# Altium project Main-Board-v1.0.PrjPcb (part 5 of 5)

## Sheet ESP32-Sheet.SchDoc
size 420 x 297 mm; SheetNumber: 4; SheetTotal: 7
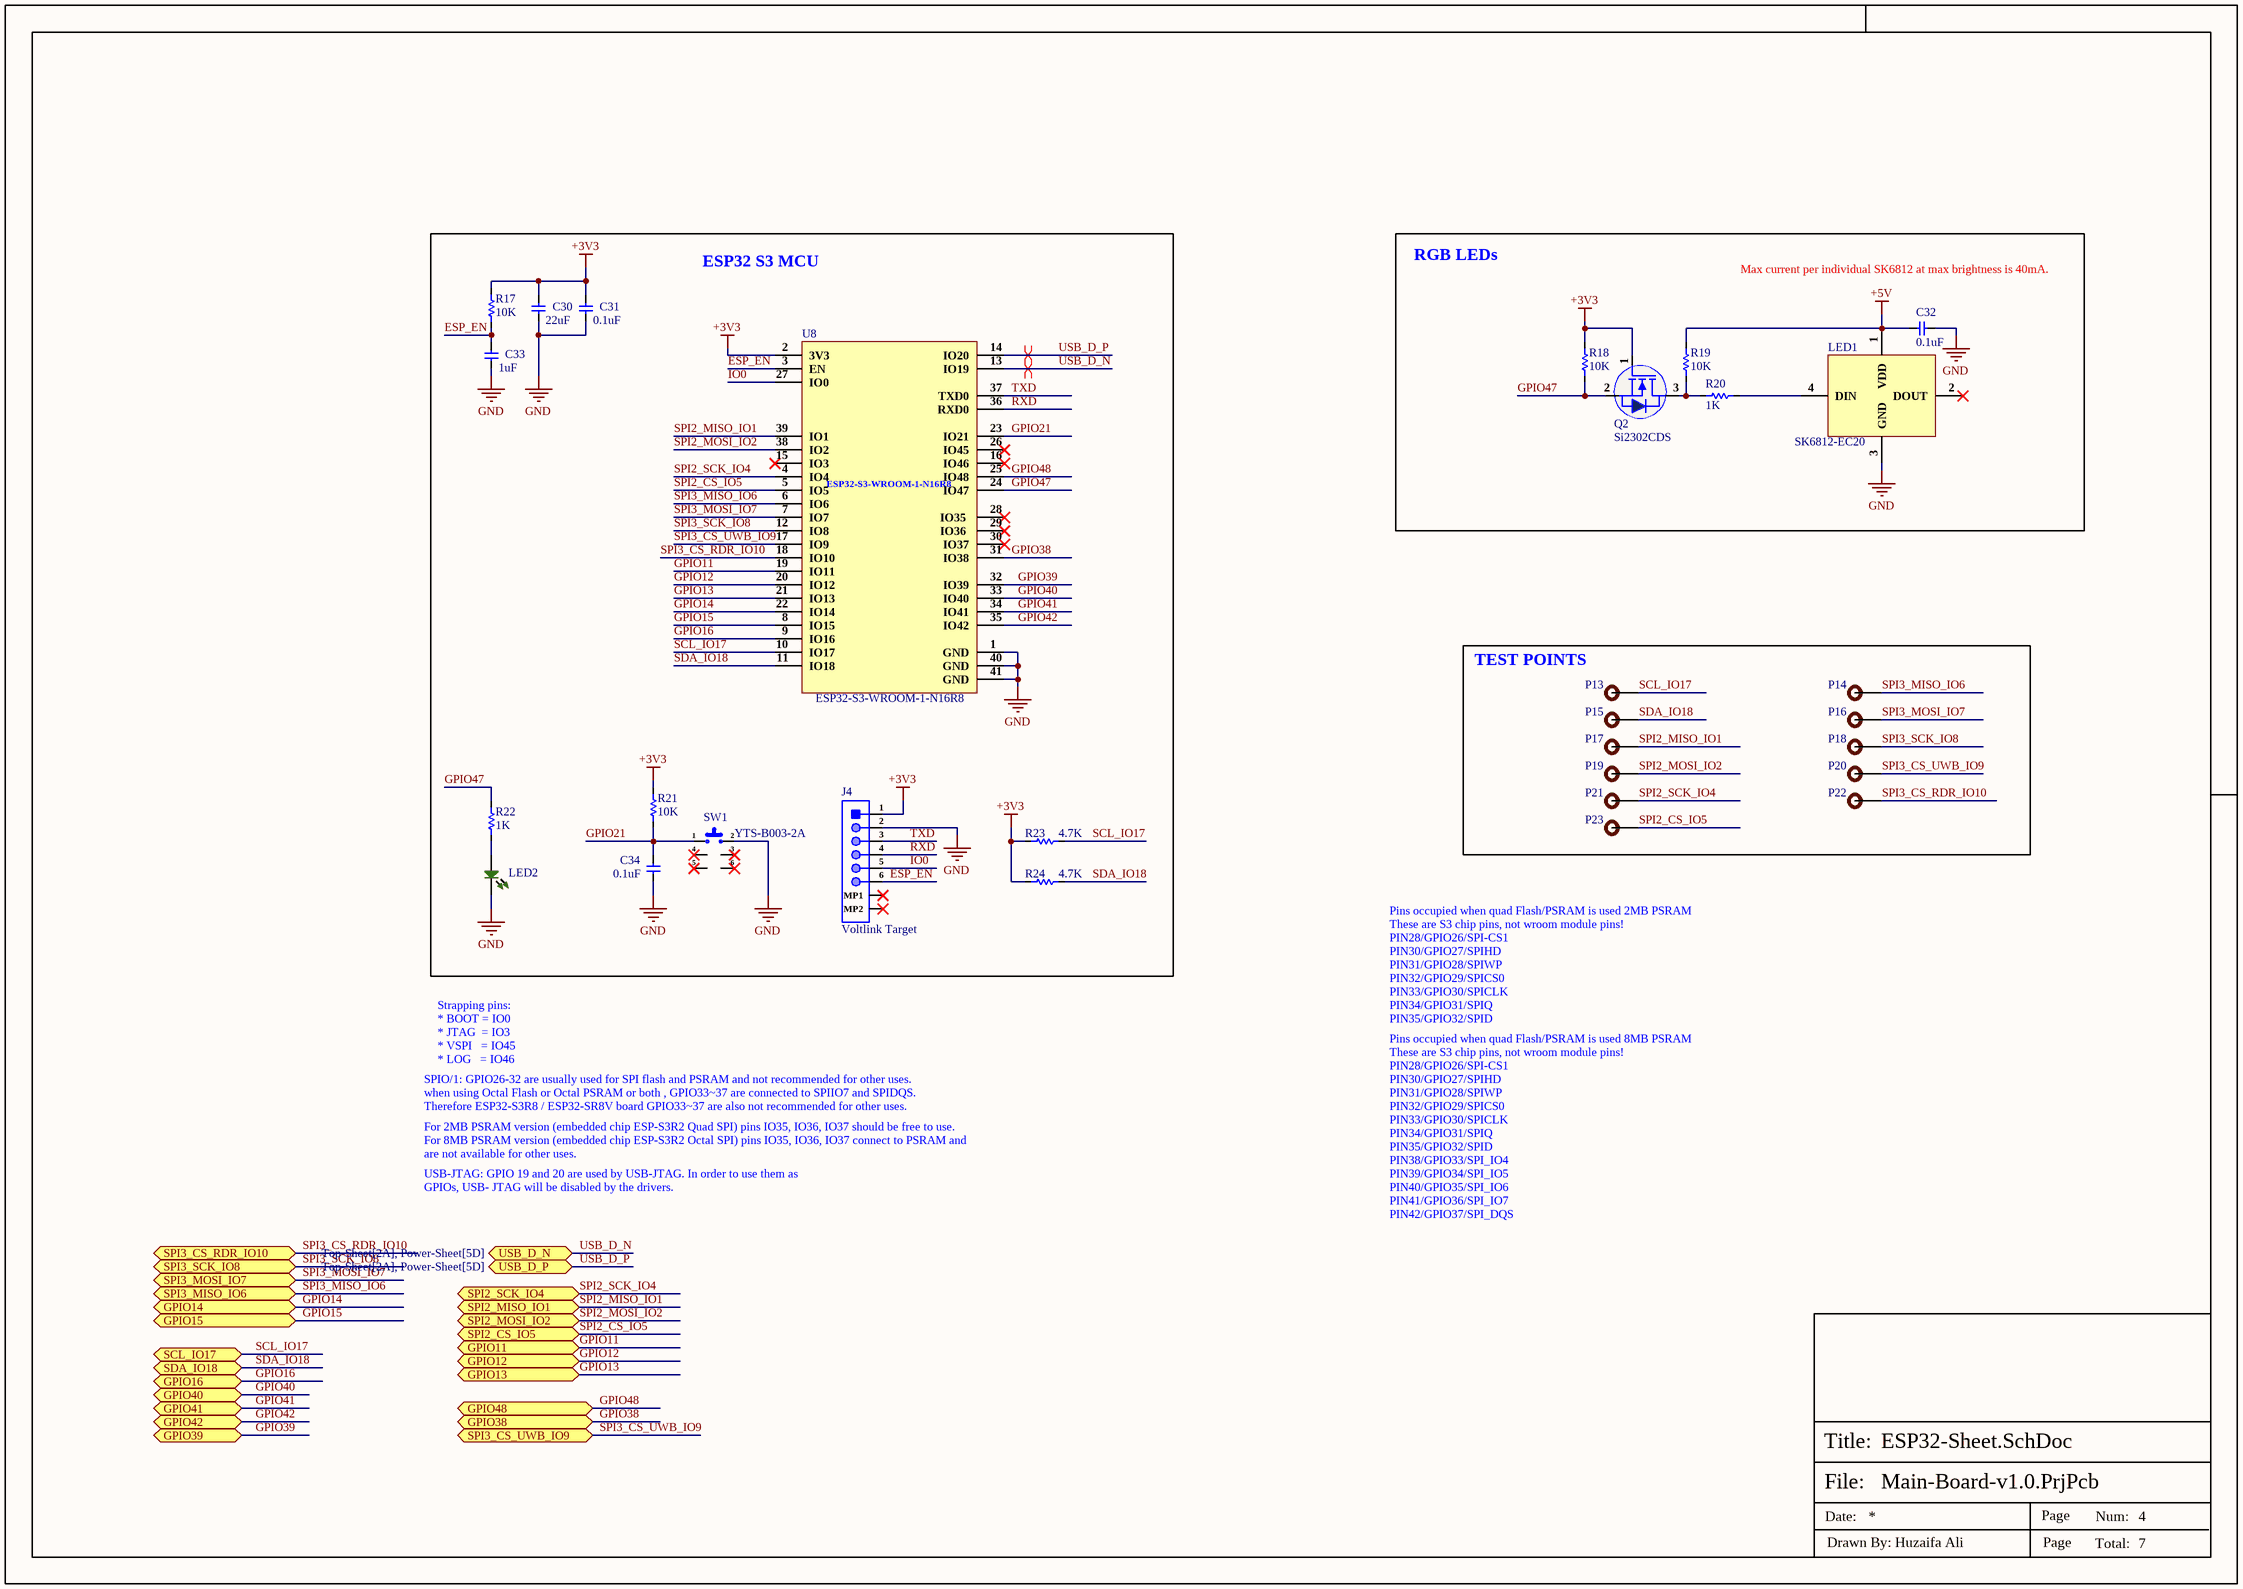
[diagram p5: ESP32-Sheet.SchDoc]

### Parts
C30  22uF  [Cap-0603]
C31  0.1uF  [Cap-0402]
C32  0.1uF  [Cap-0402]
C33  1uF  [Cap-0402]
C34  0.1uF  [Cap-0402]
J4  Voltlink Target  [Voltlink Target]
LED1  SK6812-EC20  [SK6812-EC20]
LED2  XZVG68W-2  [LED-0402]  (value not drawn)
P13  TEST POINT  [Test-point]  (value not drawn)
P14  TEST POINT  [Test-point]  (value not drawn)
P15  TEST POINT  [Test-point]  (value not drawn)
P16  TEST POINT  [Test-point]  (value not drawn)
P17  TEST POINT  [Test-point]  (value not drawn)
P18  TEST POINT  [Test-point]  (value not drawn)
P19  TEST POINT  [Test-point]  (value not drawn)
P20  TEST POINT  [Test-point]  (value not drawn)
P21  TEST POINT  [Test-point]  (value not drawn)
P22  TEST POINT  [Test-point]  (value not drawn)
P23  TEST POINT  [Test-point]  (value not drawn)
Q2  Si2302CDS  [Sot-23]
R17  10K  [Res-0402]
R18  10K  [Res-0402]
R19  10K  [Res-0402]
R20  1K  [Res-0603]
R21  10K  [Res-0603]
R22  1K  [Res-0603]
R23  4.7K  [Res-0603]
R24  4.7K  [Res-0603]
SW1  YTS-B003-2A  [YTS-B003-2A]
U8  ESP32-S3-WROOM-1-N16R8  [41-SMD Module]

### Blocks framed on the sheet
ESP32 S3 MCU: C30 C31 C33 C34 J4 LED2 R17 R21-R24 SW1 U8
RGB LEDs: C32 LED1 Q2 R18-R20
TEST POINTS: P13-P23

### Ports
GPIO11 (bidir, see Top-Sheet[2B]), GPIO12 (bidir, see Top-Sheet[2B]), GPIO13 (bidir, see Top-Sheet[2B]), GPIO14 (bidir, see Top-Sheet[3B]), GPIO15 (bidir, see Top-Sheet[3B]), GPIO16 (bidir, see Top-Sheet[3A]), GPIO38 (bidir, see Top-Sheet[3C]), GPIO39 (bidir, see Top-Sheet[3B]), GPIO40 (bidir, see Top-Sheet[3A]), GPIO41 (bidir, see Top-Sheet[3B]), GPIO42 (bidir, see Top-Sheet[3B]), GPIO48 (bidir, see Top-Sheet[3C]), SCL_IO17 (bidir, see Top-Sheet[3A]), SDA_IO18 (bidir, see Top-Sheet[3A]), SPI2_CS_IO5 (bidir, see Top-Sheet[2B]), SPI2_MISO_IO1 (bidir, see Top-Sheet[2B]), SPI2_MOSI_IO2 (bidir, see Top-Sheet[2B]), SPI2_SCK_IO4 (bidir, see Top-Sheet[2B]), SPI3_CS_RDR_IO10 (bidir, see Top-Sheet[3B]), SPI3_CS_UWB_IO9 (bidir, see Top-Sheet[3C]), SPI3_MISO_IO6 (bidir, see Top-Sheet[3B]), SPI3_MOSI_IO7 (bidir, see Top-Sheet[3B]), SPI3_SCK_IO8 (bidir, see Top-Sheet[3B]), USB_D_N (bidir, see Top-Sheet[2A], Power-Sheet[5D]), USB_D_P (bidir, see Top-Sheet[2A], Power-Sheet[5D])

### Nets
+3V3: C30.2 C31.2 J4.1 Q2.1(G) R17.2 R18.1 R21.2 R23.2 R24.2 U8.2(3V3)
+5V: C32.1 LED1.1(VDD) R19.1
GND: C30.1 C31.1 C32.2 C33.1 C34.1 J4.2 LED1.3(GND) LED2.2 SW1.2(NO) U8.1(GND) U8.40(GND) U8.41(GND)
ESP_EN: C33.2 J4.6 R17.1 U8.3(EN)
GPIO11: U8.19(IO11) ; port GPIO11  [project net W5500_RST]
GPIO12: U8.20(IO12) ; port GPIO12
GPIO13: U8.21(IO13) ; port GPIO13
GPIO14: U8.22(IO14) ; port GPIO14  [project net B5]
GPIO15: U8.8(IO15) ; port GPIO15  [project net B6]
GPIO16: U8.9(IO16) ; port GPIO16
GPIO21: C34.2 R21.1 SW1.1(COMMON) U8.23(IO21)
GPIO38: U8.31(IO38) ; port GPIO38
GPIO39: U8.32(IO39) ; port GPIO39
GPIO40: U8.33(IO40) ; port GPIO40
GPIO41: U8.34(IO41) ; port GPIO41
GPIO42: U8.35(IO42) ; port GPIO42
GPIO47: Q2.2(S) R18.2 R22.1 U8.24(IO47)
GPIO48: U8.25(IO48) ; port GPIO48
IO0: J4.5 U8.27(IO0)
RXD: J4.4 U8.36(RXD0)
SCL_IO17: P13.1 R23.1 U8.10(IO17) ; port SCL_IO17  [project net SCL]
SDA_IO18: P15.1 R24.1 U8.11(IO18) ; port SDA_IO18  [project net SDA]
SPI2_CS_IO5: P23.1 U8.5(IO5) ; port SPI2_CS_IO5
SPI2_MISO_IO1: P17.1 U8.39(IO1) ; port SPI2_MISO_IO1
SPI2_MOSI_IO2: P19.1 U8.38(IO2) ; port SPI2_MOSI_IO2
SPI2_SCK_IO4: P21.1 U8.4(IO4) ; port SPI2_SCK_IO4
SPI3_CS_RDR_IO10: P22.1 U8.18(IO10) ; port SPI3_CS_RDR_IO10  [project net B1]
SPI3_CS_UWB_IO9: P20.1 U8.17(IO9) ; port SPI3_CS_UWB_IO9
SPI3_MISO_IO6: P14.1 U8.6(IO6) ; port SPI3_MISO_IO6  [project net B4]
SPI3_MOSI_IO7: P16.1 U8.7(IO7) ; port SPI3_MOSI_IO7  [project net B3]
SPI3_SCK_IO8: P18.1 U8.12(IO8) ; port SPI3_SCK_IO8  [project net B2]
TXD: J4.3 U8.37(TXD0)
USB_D_N: U8.13(IO19) ; port USB_D_N
USB_D_P: U8.14(IO20) ; port USB_D_P
NetLED1_4: LED1.4(DIN) R20.2
NetLED2_1: LED2.1 R22.2
NetQ2_3: Q2.3(D) R19.2 R20.1

Not connected (* = marked no-connect by the designer): J4 MP1* MP2*; LED1 2(DOUT)*; SW1 3* 4* 5* 6*; U8 15(IO3)* 16(IO46)* 26(IO45)* 28(IO35_)* 29(IO36_)* 30(IO37)*

### Layout directives
differential pair; net class USB; differential pair class USB_Lines; rule Impedance Constraint [Min = 87.00    Max = 92.00    ]; rule Matched Net Lengths [Tolerance = 0.508mm]: USB_D_N, USB_D_P

### Notes on the sheet
- Max current per individual SK6812 at max brightness is 40mA.
- Strapping pins:
  * BOOT = IO0
  * JTAG  = IO3
  * VSPI   = IO45
  * LOG   = IO46
- Pins occupied when quad Flash/PSRAM is used 2MB PSRAM
  These are S3 chip pins, not wroom module pins!
  PIN28/GPIO26/SPI-CS1
  PIN30/GPIO27/SPIHD
  PIN31/GPIO28/SPIWP
  PIN32/GPIO29/SPICS0
  PIN33/GPIO30/SPICLK
  PIN34/GPIO31/SPIQ
  PIN35/GPIO32/SPID
- SPIO/1: GPIO26-32 are usually used for SPI flash and PSRAM and not recommended for other uses.
  when using Octal Flash or Octal PSRAM or both , GPIO33~37 are connected to SPIIO7 and SPIDQS.
  Therefore ESP32-S3R8 / ESP32-SR8V board GPIO33~37 are also not recommended for other uses.
- USB-JTAG: GPIO 19 and 20 are used by USB-JTAG. In order to use them as GPIOs, USB- JTAG will be disabled by the drivers.
- For 2MB PSRAM version (embedded chip ESP-S3R2 Quad SPI) pins IO35, IO36, IO37 should be free to use.
  For 8MB PSRAM version (embedded chip ESP-S3R2 Octal SPI) pins IO35, IO36, IO37 connect to PSRAM and are not available for other uses.
- Pins occupied when quad Flash/PSRAM is used 8MB PSRAM
  These are S3 chip pins, not wroom module pins!
  PIN28/GPIO26/SPI-CS1
  PIN30/GPIO27/SPIHD
  PIN31/GPIO28/SPIWP
  PIN32/GPIO29/SPICS0
  PIN33/GPIO30/SPICLK
  PIN34/GPIO31/SPIQ
  PIN35/GPIO32/SPID
  PIN38/GPIO33/SPI_IO4
  PIN39/GPIO34/SPI_IO5
  PIN40/GPIO35/SPI_IO6
  PIN41/GPIO36/SPI_IO7
  PIN42/GPIO37/SPI_DQS
- File:
- Title:
- Date:
- Page
- Num:
- Total:
- Drawn By: Huzaifa Ali

### Library data of the parts
C30 = CC0603MRX5R6BB226: CAP CER 22UF 10V X5R 0603; Manufacturer: Yageo; Tolerance: 20%; Item Type: Capacitor; Supplier 1: Digi-Key; Manufacturer Part Number: CC0603MRX5R6BB226; RoHS: Yes; Category: Ceramic Capacitors; Stock 1: 19628; Pricing 1: 1=0.68000, 10=0.48000, 50=0.36300, 100=0.31610, 500=0.23416, 1000=0.19903 (USD); Mount: Surface Mount; Case/Package: 0603; Case Code (Metric): 1608; Case Code (Imperial): 0603; Weight: 7.1E-05oz; Min Operating Temperature: -55°C; Max Operating Temperature: 85°C; Packaging: Tape and Reel; Capacitance: 22uF; Voltage Rating: 10V; Dielectric: X5R; Termination: SMD/SMT; Voltage Rating (DC): 10V; Package Quantity: 4000; Length: 0.063inch; Width: 0.8mm; Height: 0.8mm; Thickness: 0.035inch; Lead Free: Lead Free; Halogen Free: Halogen Free; RoHS Compliant: Yes; ComponentLink1URL: http://www.mouser.com/ds/2/447/Yageo_UPY-GP_NP0_16V-to-50V_9-358835.pdf?src-supplier=Mouser; ComponentLink1Description: http://www.mouser.com/ds/2/447/Yageo_UPY-GP_NP0_16V-to-50V_9-358835.pdf?src-supplier=Mouser; ComponentLink2URL: http://www.yageo.com/documents/recent/UPY-GPHC_X5R_4V-to-50V_25.pdf?src-supplier=Digi-Key; ComponentLink2Description: http://www.yageo.com/documents/recent/UPY-GPHC_X5R_4V-to-50V_25.pdf?src-supplier=Digi-Key; Supplier Part Number 1: 311-1819-1-ND; LCSC Part Number: C109447
C31 C32 C34 = C1005X5R1H104K050BB: CAP CER 0.1UF 50V X5R 0402; Manufacturer: TDK; Dielectric Material: Ceramic; Capacitance: 100nF; Tolerance: 10%; Supplier 1: Digi-Key; Manufacturer Part Number: C1005X5R1H104K050BB; Stock 1: 1455182; Pricing 1: 1=0.12, 10=0.09, 50=0.049, 100=0.04, 500=0.02858, 1000=0.02245, 2500=0.02041, 5000=0.01878 (USD); Mount: Surface Mount; Case/Package: 0402; Case Code (Metric): 1005; Case Code (Imperial): 0402; Weight: 2.3E-05oz; Min Operating Temperature: -55°C; Max Operating Temperature: 85°C; Dielectric: X5R; Voltage Rating: 50V; Packaging: Tape and Reel; Voltage Rating (DC): 50V; Termination: SMD/SMT; Construction: Flat; Package Quantity: 1; Resistor Type: Ceramic; Voltage: 50V; Series: C; Length: 1mm; Width: 0.02inch; Height: 0.5mm; Depth: 0.5mm; Thickness: 0.022inch; Radiation Hardening: No; Lead Free: Lead Free; REACH SVHC: No SVHC; RoHS Compliant: Yes; ComponentLink1URL: https://product.tdk.com/info/en/catalog/spec/mlccspec_commercial_general_midvoltage_en.pdf?src-supplier=Digi-Key; ComponentLink1Description: https://product.tdk.com/info/en/catalog/spec/mlccspec_commercial_general_midvoltage_en.pdf?src-supplier=Digi-Key; ComponentLink2URL: http://www.tdk.co.jp/tefe02/e413_c.pdf?src-supplier=Future+Electronics; ComponentLink2Description: http://www.tdk.co.jp/tefe02/e413_c.pdf?src-supplier=Future+Electronics; ComponentLink3URL: https://www.verical.com/server-webapp/html/getDatasheet?partID=743571&src-supplier=Verical; ComponentLink3Description: https://www.verical.com/server-webapp/html/getDatasheet?partID=743571&src-supplier=Verical; ComponentLink4URL: http://www.tdk.co.jp/tefe02/e412_c.pdf?src-supplier=Avnet+Europe; ComponentLink4Description: http://www.tdk.co.jp/tefe02/e412_c.pdf?src-supplier=Avnet+Europe; Supplier Part Number 1: 445-5942-1-ND; LCSC Part Number: C2181865
C33 = CC0402KRX5R6BB105: CAP CER 1UF 10V X5R 0402; Manufacturer: Yageo; Tolerance: 10%; Dissipation Factor: 15%; Supplier 1: Mouser; Manufacturer Part Number: CC0402KRX5R6BB105; RoHS: Yes; Category: Ceramic Capacitors; Stock 1: 6711367; Pricing 1: 1=0.11000, 10=0.05500, 50=0.05500, 100=0.03300, 500=0.02700, 1000=0.02200, 2500=0.02100, 10000=0.01800 (USD); Mount: Surface Mount; Case/Package: 0402; Number of Pins: 2; Case Code (Metric): 1005; Case Code (Imperial): 0402; Min Operating Temperature: -55°C; Max Operating Temperature: 85°C; Capacitance: 1uF; Dielectric: X5R; Package Quantity: 1; Voltage Rating: 10V; Packaging: Tape and Reel; Voltage Rating (DC): 10V; Termination: SMD/SMT; Resistor Type: Ceramic; Series: CC; Construction: Flat; Length: 1mm; Width: 0.02inch; Height: 0.5mm; Thickness: 0.022inch; Depth: 0.5mm; Radiation Hardening: No; REACH SVHC: No SVHC; Lead Free: Lead Free; Halogen Free: Halogen Free; RoHS Compliant: Yes; ComponentLink1URL: https://datasheet.ciiva.com/176/upy-gphc-x5r-4v-to-50v-12-176704.pdf?src-supplier=Digi-Key; ComponentLink1Description: https://datasheet.ciiva.com/176/upy-gphc-x5r-4v-to-50v-12-176704.pdf?src-supplier=Digi-Key; ComponentLink2URL: https://datasheet.ciiva.com/176/mlccorderingcode-176705.pdf?src-supplier=Digi-Key; ComponentLink2Description: https://datasheet.ciiva.com/176/mlccorderingcode-176705.pdf?src-supplier=Digi-Key; ComponentLink3URL: https://datasheet.ciiva.com/176/mlccorderingcode-176706.pdf?src-supplier=Digi-Key; ComponentLink3Description: https://datasheet.ciiva.com/176/mlccorderingcode-176706.pdf?src-supplier=Digi-Key; Supplier Part Number 1: 603-CC402KRX5R6BB105; LCSC Part Number: C106254
J4 = C145963: 1x6P SH 1 1mm 6 SMD,P=1mm Wire To Board / Wire To Wire Connector ROHS; Manufacturer: BOOMELE; Manufacturer Part Number: C145963; Package: SMD,P=1mm; LCSC Part Number: C145963; Item Type: Connector; ComponentLink1Description: LCSC; ComponentLink1URL: https://www.lcsc.com/product-detail/Wire-To-Board-Wire-To-Wire-Connector_BOOMELE-Boom-Precision-Elec-C145963_C145963.html
LED1 = SK6812-EC20: 5mA -40℃~+80℃ RGB SMD,2x2mm Light Emitting Diodes (LED) ROHS; Manufacturer: OPSCO Optoelectronics; Item Type: RGB LED; Manufacturer Part Number: SK6812-EC20; Package: SMD,2x2mm; LCSC Part Number: C2909058; ComponentLink1Description: LCSC; ComponentLink1URL: https://www.lcsc.com/product-detail/Light-Emitting-Diodes-LED_OPSCO-Optoelectronics-SK6812-EC20_C2909058.html
LED2 = XZVG68W-2: LED GREEN CLEAR CHIP SMD; Manufacturer: SunLED; Lens Color: Colorless; Luminous Intensity: 49mcd; Test Current: 20mA; Viewing Angle: 120°; Dominant Wavelength: 570nm; Forward Voltage: 2.1V; Supplier 1: Digi-Key; Manufacturer Part Number: XZVG68W-2; Stock 1: 4185; Pricing 1: 1=0.5, 10=0.36, 100=0.16, 500=0.112, 1000=0.092 (USD); Mount: Surface Mount; Case/Package: 0402; Color: Green; Case Code (Metric): 1005; Case Code (Imperial): 0402; Packaging: Tape and Reel; Lens Transparency: Clear; Length: 1mm; Height: 0.6mm; Width: 0.5mm; ComponentLink1URL: http://www.sunledusa.com/products/spec/XZVG68W-2.pdf?src-supplier=Digi-Key; ComponentLink1Description: http://www.sunledusa.com/products/spec/XZVG68W-2.pdf?src-supplier=Digi-Key; ComponentLink2URL: https://www.sunledusa.com/products/spec/XZVG68W-2.pdf?src-supplier=Digi-Key; ComponentLink2Description: https://www.sunledusa.com/products/spec/XZVG68W-2.pdf?src-supplier=Digi-Key; Supplier Part Number 1: 1497-1219-6-ND; Item Type: LED
P13-P23 = TEST POINT: Test Point ON; Item Type: TEST POINT
Q2 = Si2302CDS: N-CHANNEL 20-V (D-S) MOSFET; Manufacturer: TECH PUBLIC; ComponentLink1Description: LCSC; ComponentLink1URL: https://www.lcsc.com/product-detail/MOSFETs_TECH-PUBLIC-SI2302CDS_C5310968.html; Manufacturer Part Number: SI2302CDS; Package: SOT-23; LCSC Part Number: C5310968; Item Type: Mosfet
R17-R19 = RC0402FR-0710KL: RES 10K OHM 1% 1/16W 0402; Manufacturer: Yageo; Resistance: 10kR; Voltage Rating (DC): 50V; Temperature Coefficient: 100ppm/°C; Power Rating: 62.5mW; Max Power Dissipation: 63mW; Item Type: Resistor; Supplier 1: Mouser; Manufacturer Part Number: RC0402FR-0710KL; RoHS: Yes; Category: Chip SMD Resistors; Stock 1: 18648329; Pricing 1: 1=0.10000, 10=0.01400, 50=0.01400, 100=0.00500, 1000=0.00300, 10000=0.00200 (USD); Case/Package: 0402; Number of Pins: 2; Case Code (Imperial): 0402; Case Code (Metric): 1005; Min Operating Temperature: -55°C; Max Operating Temperature: 155°C; Resistor Type: Thick Film; Tolerance: 1%; Packaging: Tape and Reel; Voltage Rating: 50V; Termination: SMD/SMT; Working Voltage: 50V; Number of Terminations: 2; Features: Moisture Resistant; Series: RC; Resistance Tolerance: 1%; Construction: Rectangular; Length: 1mm; Width: 0.5mm; Height: 0.32mm; Depth: 0.5mm; Lead Pitch: 0.2mm; REACH SVHC: No SVHC; Lead Free: Lead Free; RoHS Compliant: Yes; Military Standard: Not; ComponentLink1URL: https://datasheet.ciiva.com/7660/38568-7660787.pdf?src-supplier=Element14; ComponentLink1Description: https://datasheet.ciiva.com/7660/38568-7660787.pdf?src-supplier=Element14; ComponentLink2URL: https://datasheet.ciiva.com/7849/1686128-7849814.pdf?src-supplier=Element14; ComponentLink2Description: https://datasheet.ciiva.com/7849/1686128-7849814.pdf?src-supplier=Element14; ComponentLink3URL: https://datasheet.ciiva.com/7983/1018594-7983486.pdf?src-supplier=Element14; ComponentLink3Description: https://datasheet.ciiva.com/7983/1018594-7983486.pdf?src-supplier=Element14; ComponentLink4URL: https://datasheet.ciiva.com/22747/1018594-22747512.pdf?src-supplier=Element14; ComponentLink4Description: https://datasheet.ciiva.com/22747/1018594-22747512.pdf?src-supplier=Element14; ComponentLink5URL: https://datasheet.ciiva.com/12667/pyu-rc0402-51-rohs-l-6-r-12667067.pdf?src-supplier=Mouser; ComponentLink5Description: https://datasheet.ciiva.com/12667/pyu-rc0402-51-rohs-l-6-r-12667067.pdf?src-supplier=Mouser; ComponentLink6URL: https://datasheet.ciiva.com/7849/1784430-7849813.pdf?src-supplier=Element14; ComponentLink6Description: https://datasheet.ciiva.com/7849/1784430-7849813.pdf?src-supplier=Element14; ComponentLink7URL: https://datasheet.ciiva.com/7849/1784430-7849815.pdf?src-supplier=Element14; ComponentLink7Description: https://datasheet.ciiva.com/7849/1784430-7849815.pdf?src-supplier=Element14; Supplier Part Number 1: 603-RC0402FR-0710KL; LCSC Part Number: C60490
R20 R22 = RC0603FR-071KL: RES SMD 1K OHM 1% 1/10W 0603; Manufacturer: Yageo; Resistance: 1kR; Temperature Coefficient: 100ppm/°C; Power Rating: 100mW; Voltage Rating: 50V; Item type: Resistor; ComponentLink1URL: https://www.verical.com/server-webapp/html/getDatasheet?partID=409289&src-supplier=Verical; ComponentLink1Description: https://www.verical.com/server-webapp/html/getDatasheet?partID=409289&src-supplier=Verical; Supplier 1: Digi-Key; Manufacturer Part Number: RC0603FR-071KL; Stock 1: 21472395; Pricing 1: 1=0.1, 10=0.023, 100=0.0094, 1000=0.0042, 2500=0.0037 (USD); Case/Package: 0603; Contact Plating: Tin,Matte; Case Code (Imperial): 0603; Case Code (Metric): 1608; Min Operating Temperature: -55°C; Max Operating Temperature: 155°C; Tolerance: 1%; Composition: Thick Film; Packaging: Tape and Reel; Termination: SMD/SMT; Military Standard: Not; Length: 1.6mm; Height: 0.45mm; Depth: 0.8mm; Radiation Hardening: No; REACH SVHC: No SVHC; Lead Free: Lead Free; ComponentLink2URL: http://documents.rs-components.com/techlib://itc_doclist_GB.htm?stockno=5048928&src-supplier=RSComponents; ComponentLink2Description: http://documents.rs-components.com/techlib://itc_doclist_GB.htm?stockno=5048928&src-supplier=RSComponents; ComponentLink3URL: http://www.yageo.com/documents/recent/PYu-RC0603_51_RoHS_L_4.pdf?src-supplier=Avnet+Europe; ComponentLink3Description: http://www.yageo.com/documents/recent/PYu-RC0603_51_RoHS_L_4.pdf?src-supplier=Avnet+Europe; ComponentLink4URL: http://www.farnell.com/datasheets/2167052.pdf?src-supplier=Element14; ComponentLink4Description: http://www.farnell.com/datasheets/2167052.pdf?src-supplier=Element14; ComponentLink5URL: http://www.farnell.com/datasheets/1868787.pdf?src-supplier=Element14; ComponentLink5Description: http://www.farnell.com/datasheets/1868787.pdf?src-supplier=Element14; ComponentLink6URL: http://www.yageo.com/documents/recent/PYu-RC_Group_51_RoHS_L_2.pdf?src-supplier=Avnet; ComponentLink6Description: http://www.yageo.com/documents/recent/PYu-RC_Group_51_RoHS_L_2.pdf?src-supplier=Avnet; ComponentLink7URL: https://www.verical.com/server-webapp/html/getDatasheet?partID=404327&src-supplier=Verical; ComponentLink7Description: https://www.verical.com/server-webapp/html/getDatasheet?partID=404327&src-supplier=Verical; ComponentLink8URL: http://www.farnell.com/datasheets/443971.pdf?src-supplier=Element14; ComponentLink8Description: http://www.farnell.com/datasheets/443971.pdf?src-supplier=Element14; Supplier Part Number 1: 311-1.00KHRDKR-ND; LCSC Part Number: C22548
R21 = RC0603FR-0710KL: RES SMD 10K Ohm 1% 1/10W 0603; Manufacturer: Yageo; Resistance: 10kR; Temperature Coefficient: 100ppm/°C; Voltage Rating (DC): 50V; Power Rating: 100mW; Voltage Rating: 75V; Item Type: Resistor; Supplier 1: Digi-Key; Manufacturer Part Number: RC0603FR-0710KL; RoHS: Yes; Category: Chip SMD Resistors; Stock 1: 25249139; Pricing 1: 1=0.10000, 10=0.02400, 100=0.00970, 1000=0.00436, 2500=0.00378 (USD); Case/Package: 0603; Number of Pins: 2; Case Code (Imperial): 0603; Case Code (Metric): 1608; Weight: 7.1E-05oz; Size Code: 0603; Min Operating Temperature: -55°C; Max Operating Temperature: 155°C; Tolerance: 1%; Resistor Type: Thick Film; Packaging: Tape and Reel; Termination: SMD/SMT; Features: Moisture Resistant; Series: RC; Max Power Dissipation: 100mW; Number of Terminations: 2; Resistance Tolerance: 1%; Construction: Rectangular; Length: 1.6mm; Width: 0.8mm; Height: 0.45mm; Depth: 0.8mm; Lead Pitch: 0.3mm; REACH SVHC: Unknown; Lead Free: Lead Free; Military Standard: Not; RoHS Compliant: Yes; ComponentLink1URL: https://datasheet.ciiva.com/7660/38590-7660789.pdf?src-supplier=Element14; ComponentLink1Description: https://datasheet.ciiva.com/7660/38590-7660789.pdf?src-supplier=Element14; ComponentLink2URL: https://datasheet.ciiva.com/7983/443971-7983596.pdf?src-supplier=Element14; ComponentLink2Description: https://datasheet.ciiva.com/7983/443971-7983596.pdf?src-supplier=Element14; ComponentLink3URL: https://datasheet.ciiva.com/22747/443971-22747519.pdf?src-supplier=Element14; ComponentLink3Description: https://datasheet.ciiva.com/22747/443971-22747519.pdf?src-supplier=Element14; ComponentLink4URL: https://datasheet.ciiva.com/46440/1868787-46440891.pdf?src-supplier=Element14; ComponentLink4Description: https://datasheet.ciiva.com/46440/1868787-46440891.pdf?src-supplier=Element14; ComponentLink5URL: https://datasheet.ciiva.com/7746/1738695-7746239.pdf?src-supplier=Element14; ComponentLink5Description: https://datasheet.ciiva.com/7746/1738695-7746239.pdf?src-supplier=Element14; ComponentLink6URL: https://datasheet.ciiva.com/15189/getdatasheetpartid-409289-15189591.pdf?src-supplier=Verical; ComponentLink6Description: https://datasheet.ciiva.com/15189/getdatasheetpartid-409289-15189591.pdf?src-supplier=Verical; Supplier Part Number 1: 311-10.0KHRCT-ND; LCSC Part Number: C98220
R23 R24 = RC0603FR-074K7L: RES SMD 4.7K OHM 1% 1/10W 0603; Manufacturer: Yageo; Item Type: Resistor; Manufacturer Part Number: RC0603FR-074K7L; Package: 0603; ComponentLink7Description: LCSC; ComponentLink7URL: https://www.lcsc.com/product-detail/Chip-Resistor-Surface-Mount_YAGEO-RC0603FR-074K7L_C99782.html; LCSC Part Number: C99782
SW1 = YTS-B003-2A: 3.5mm 3.5mm SMDSplicing Black Rectangle button 50mA Surface Mount 7mm SPST 100MΩ 20000 12V 250gf@±50gf SMD Tactile Switches ROHS; Manufacturer: YIYUAN; Manufacturer Part Number: YTS-B003-2A; Package: Custom; LCSC Part Number: C2910695; ComponentLink1Description: LCSC; ComponentLink1URL: https://lcsc.com/product-detail/Tactile-Switches_YIYUAN-YTS-B003-2A_C2910695.html; Item Type: Tactile Switch
U8 = ESP32-S3-WROOM-1-N16R8: SMD MODULE, ESP32-S3R8 WITH 3.3V; Manufacturer: Espressif Systems; Supplier 1: Digi-Key; Manufacturer Part Number: ESP32-S3-WROOM-1-N16R8; RoHS: No; Category: Uncategorized; Stock 1: 423; Pricing 1: 1=4.29000 (USD); Supplier Part Number 1: 1965-ESP32-S3-WROOM-1-N16R8CT-ND; LCSC Part Number: C2913202; Item Type: Module; ComponentLink1Description: LCSC; ComponentLink1URL: https://www.lcsc.com/product-detail/WiFi-Modules_Espressif-Systems-ESP32-S3-WROOM-1-N16R8_C2913202.html

## Sheet UWB-Sheet.SchDoc
size A4; SheetNumber: 5; SheetTotal: 7
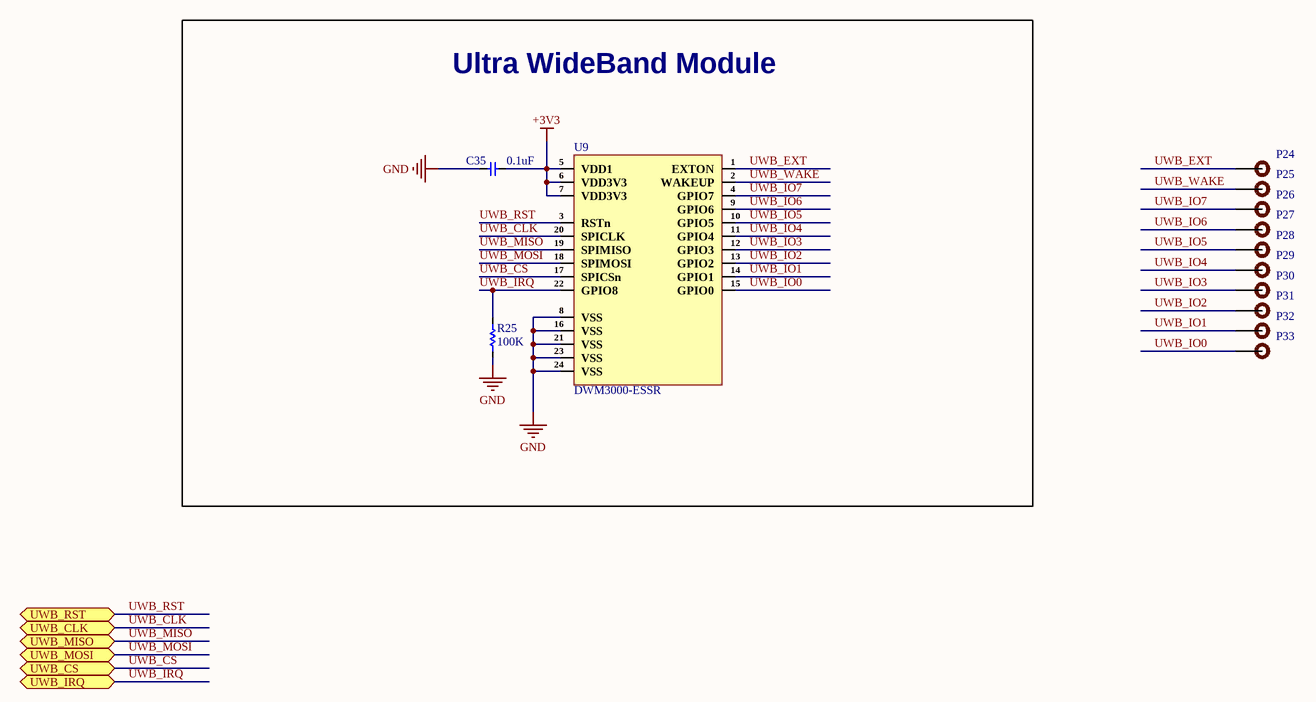
[diagram p6: UWB-Sheet.SchDoc]

### Parts
C35  0.1uF  [Cap-0603]
P24  TEST POINT  [Test-point]  (value not drawn)
P25  TEST POINT  [Test-point]  (value not drawn)
P26  TEST POINT  [Test-point]  (value not drawn)
P27  TEST POINT  [Test-point]  (value not drawn)
P28  TEST POINT  [Test-point]  (value not drawn)
P29  TEST POINT  [Test-point]  (value not drawn)
P30  TEST POINT  [Test-point]  (value not drawn)
P31  TEST POINT  [Test-point]  (value not drawn)
P32  TEST POINT  [Test-point]  (value not drawn)
P33  TEST POINT  [Test-point]  (value not drawn)
R25  100K  [Res-0603]
U9  DWM3000-ESSR  [DWM3000_ESSR]

### Blocks framed on the sheet
Ultra WideBand Module: C35 R25 U9

### Ports
UWB_CLK (bidir, see Top-Sheet[3C]), UWB_CS (bidir, see Top-Sheet[3C]), UWB_IRQ (bidir, see Top-Sheet[3C]), UWB_MISO (bidir, see Top-Sheet[3C]), UWB_MOSI (bidir, see Top-Sheet[3C]), UWB_RST (bidir, see Top-Sheet[3C])

### Nets
+3V3: C35.1 U9.5(VDD1) U9.6(VDD3V3) U9.7(VDD3V3)
GND: C35.2 R25.1 U9.8(VSS) U9.16(VSS) U9.21(VSS) U9.23(VSS) U9.24(VSS)
UWB_CLK: U9.20(SPICLK) ; port UWB_CLK  [project net B2]
UWB_CS: U9.17(SPICSn) ; port UWB_CS  [project net SPI3_CS_UWB_IO9]
UWB_EXT: P24.1 U9.1(EXTON)
UWB_IO0: P33.1 U9.15(GPIO0)
UWB_IO1: P32.1 U9.14(GPIO1)
UWB_IO2: P31.1 U9.13(GPIO2)
UWB_IO3: P30.1 U9.12(GPIO3)
UWB_IO4: P29.1 U9.11(GPIO4)
UWB_IO5: P28.1 U9.10(GPIO5)
UWB_IO6: P27.1 U9.9(GPIO6)
UWB_IO7: P26.1 U9.4(GPIO7)
UWB_IRQ: R25.2 U9.22(GPIO8) ; port UWB_IRQ  [project net GPIO48]
UWB_MISO: U9.19(SPIMISO) ; port UWB_MISO  [project net B4]
UWB_MOSI: U9.18(SPIMOSI) ; port UWB_MOSI  [project net B3]
UWB_RST: U9.3(RSTn) ; port UWB_RST  [project net GPIO38]
UWB_WAKE: P25.1 U9.2(WAKEUP)

### Notes on the sheet
- File:
- Title:
- Date:
- Page
- Num:
- Total:
- Drawn By: Huzaifa Ali

### Library data of the parts
C35 = CC0603KRX7R0BB104: CAP CER 0.1UF 100V X7R 0603; Manufacturer: Yageo; Capacitance: 100nF; Tolerance: 10%; Item Type: Capacitor; Supplier 1: Digi-Key; Manufacturer Part Number: CC0603KRX7R0BB104; RoHS: Yes; Category: Ceramic Capacitors; Stock 1: 60476; Pricing 1: 1=0.19000, 10=0.13500, 50=0.07680, 100=0.06370, 500=0.04466, 1000=0.03696 (USD); Mount: Surface Mount; Case/Package: 0603; Case Code (Metric): 1608; Case Code (Imperial): 0603; Weight: 7.1E-05oz; Min Operating Temperature: -55°C; Max Operating Temperature: 125°C; Package Quantity: 4000; Voltage Rating: 100V; Packaging: Tape and Reel; Dielectric: X7R; Termination: SMD/SMT; Resistor Type: Ceramic; Voltage Rating (DC): 100V; Series: CC; Length: 0.063inch; Width: 0.031inch; Thickness: 0.035inch; Depth: 0.8mm; Lead Free: Lead Free; RoHS Compliant: Yes; ComponentLink1URL: https://datasheet.ciiva.com/6277/mlccorderingcode-6277030.pdf?src-supplier=Digi-Key; ComponentLink1Description: https://datasheet.ciiva.com/6277/mlccorderingcode-6277030.pdf?src-supplier=Digi-Key; ComponentLink2URL: https://datasheet.ciiva.com/6277/mlccorderingcode-6277081.pdf?src-supplier=Digi-Key; ComponentLink2Description: https://datasheet.ciiva.com/6277/mlccorderingcode-6277081.pdf?src-supplier=Digi-Key; ComponentLink3URL: https://datasheet.ciiva.com/6277/mlccorderingcode-6277082.pdf?src-supplier=Digi-Key; ComponentLink3Description: https://datasheet.ciiva.com/6277/mlccorderingcode-6277082.pdf?src-supplier=Digi-Key; Supplier Part Number 1: 311-1523-1-ND; LCSC Part Number: C113803
P24-P33 = TEST POINT: Test Point ON; Item Type: TEST POINT
R25 = RC0603JR-07100KL: RES 100K OHM 5% 1/10W 0603; Manufacturer: Yageo; Resistance: 100kR; Temperature Coefficient: 100ppm/°C; Voltage Rating: 50V; Power Rating: 100mW; Item Type: Resistor; Supplier 1: Digi-Key; Manufacturer Part Number: RC0603JR-07100KL; RoHS: Yes; Category: Chip SMD Resistors; Stock 1: 1210037; Pricing 1: 1=0.10000, 10=0.02000, 100=0.00800, 1000=0.00360, 2500=0.00312 (USD); Case/Package: 0603; Number of Pins: 2; Contact Plating: Tin,Matte; Case Code (Imperial): 0603; Case Code (Metric): 1608; Size Code: 0603; Min Operating Temperature: -55°C; Max Operating Temperature: 155°C; Tolerance: 5%; Resistor Type: Thick Film; Packaging: Tape and Reel; Voltage Rating (DC): 50V; Termination: SMD/SMT; Features: Moisture Resistant; Series: RC; Max Power Dissipation: 100mW; Number of Terminations: 2; Resistance Tolerance: 5%; Width: 0.8mm; Radiation Hardening: No; REACH SVHC: No SVHC; Lead Free: Lead Free; RoHS Compliant: Yes; ComponentLink1URL: https://datasheet.ciiva.com/7746/443971-7746424.pdf?src-supplier=Element14; ComponentLink1Description: https://datasheet.ciiva.com/7746/443971-7746424.pdf?src-supplier=Element14; ComponentLink2URL: https://datasheet.ciiva.com/7983/443971-7983686.pdf?src-supplier=Element14; ComponentLink2Description: https://datasheet.ciiva.com/7983/443971-7983686.pdf?src-supplier=Element14; ComponentLink3URL: https://datasheet.ciiva.com/7746/443971-7746423.pdf?src-supplier=Element14; ComponentLink3Description: https://datasheet.ciiva.com/7746/443971-7746423.pdf?src-supplier=Element14; ComponentLink4URL: https://datasheet.ciiva.com/8887/pyu-rc0603-51-rohs-l-4-8887903.pdf?src-supplier=Avnet; ComponentLink4Description: https://datasheet.ciiva.com/8887/pyu-rc0603-51-rohs-l-4-8887903.pdf?src-supplier=Avnet; Supplier Part Number 1: 311-100KGRCT-ND; LCSC Part Number: C100048
U9 = DWM3000-ESSR: RF Modules ENGINEERING SAMPLE; Manufacturer: Qorvo; Item Type: Module; Supplier 1: Mouser; Manufacturer Part Number: DWM3000-ESSR; Stock 1: 282; Pricing 1: 1=24, 10=24, 25=19.44, 50=19.44, 100=14.9, 1000=14.9, 10000=14.9 (USD); Supplier Part Number 1: 772-DWM3000-ESSR; ComponentLink1Description: LCSC; ComponentLink1URL: https://eu.mouser.com/ProductDetail/Qorvo/DWM3000-ESSR?qs=DPoM0jnrROUKQ7mLMYYEbQ%3D%3D

## Nets that join several sheets
1V8_SENSOR: Power-Sheet (C15.2 C16.2 P7.1 U4.5), Sensor-Sheet (J2.8), Level_Shifter_Sheet (FB7.1)
3V3_SENSOR: Power-Sheet (C17.2 FB3.2 P8.1), Sensor-Sheet (J2.9)
+3V3: Power-Sheet (C8.1 P6.1 R9.2 U3.3), Sensor-Sheet (9 pins), Ethernet-Sheet (C36.2 Q4.2 R27.1 R28.1), Level_Shifter_Sheet (FB8.1), ESP32-Sheet (10 pins), UWB-Sheet (C35.1 U9.5 U9.6 U9.7)
+5V: Power-Sheet (8 pins), Sensor-Sheet (C25.2 FB4.1), ESP32-Sheet (C32.1 LED1.1 R19.1)
GND: Power-Sheet (37 pins), Sensor-Sheet (9 pins), Ethernet-Sheet (35 pins), Level_Shifter_Sheet (C55.1 C56.1 U12.11), ESP32-Sheet (12 pins), UWB-Sheet (7 pins)
W5500_RST: Ethernet-Sheet (R38.2 U10.37), ESP32-Sheet (U8.19)
A1: Sensor-Sheet (J2.2), Level_Shifter_Sheet (U12.1)
A2: Sensor-Sheet (J2.3), Level_Shifter_Sheet (U12.3)
A3: Sensor-Sheet (J2.4), Level_Shifter_Sheet (U12.4)
A4: Sensor-Sheet (J2.5), Level_Shifter_Sheet (U12.5)
A5: Sensor-Sheet (J2.6), Level_Shifter_Sheet (U12.6)
A6: Sensor-Sheet (J2.7), Level_Shifter_Sheet (U12.7)
B1: Level_Shifter_Sheet (U12.20), ESP32-Sheet (P22.1 U8.18)
B2: Level_Shifter_Sheet (U12.18), ESP32-Sheet (P18.1 U8.12), UWB-Sheet (U9.20)
B3: Level_Shifter_Sheet (U12.17), ESP32-Sheet (P16.1 U8.7), UWB-Sheet (U9.18)
B4: Level_Shifter_Sheet (U12.16), ESP32-Sheet (P14.1 U8.6), UWB-Sheet (U9.19)
B5: Level_Shifter_Sheet (U12.15), ESP32-Sheet (U8.22)
B6: Level_Shifter_Sheet (U12.14), ESP32-Sheet (U8.8)
GPIO12: Ethernet-Sheet (R36.2 U10.36), ESP32-Sheet (U8.20)
GPIO13: Ethernet-Sheet (Q3.1), ESP32-Sheet (U8.21)
GPIO16: Sensor-Sheet (J2.12), ESP32-Sheet (U8.9)
GPIO38: ESP32-Sheet (U8.31), UWB-Sheet (U9.3)
GPIO39: Sensor-Sheet (J3.3 R15.2), ESP32-Sheet (U8.32)
GPIO40: Sensor-Sheet (J3.4 P12.1), ESP32-Sheet (U8.33)
GPIO41: Sensor-Sheet (J3.5 P11.1), ESP32-Sheet (U8.34)
GPIO42: Sensor-Sheet (J3.6 R14.2), ESP32-Sheet (U8.35)
GPIO48: ESP32-Sheet (U8.25), UWB-Sheet (R25.2 U9.22)
LAN_PWR_N: Power-Sheet (6 pins), Ethernet-Sheet (J5.10)
LAN_PWR_P: Power-Sheet (9 pins), Ethernet-Sheet (J5.9)
SCL: Sensor-Sheet (J2.11 U7.4), ESP32-Sheet (P13.1 R23.1 U8.10)
SDA: Sensor-Sheet (J2.10 U7.3), ESP32-Sheet (P15.1 R24.1 U8.11)
SPI2_CS_IO5: Ethernet-Sheet (U10.32), ESP32-Sheet (P23.1 U8.5)
SPI2_MISO_IO1: Ethernet-Sheet (U10.34), ESP32-Sheet (P17.1 U8.39)
SPI2_MOSI_IO2: Ethernet-Sheet (U10.35), ESP32-Sheet (P19.1 U8.38)
SPI2_SCK_IO4: Ethernet-Sheet (U10.33), ESP32-Sheet (P21.1 U8.4)
SPI3_CS_UWB_IO9: ESP32-Sheet (P20.1 U8.17), UWB-Sheet (U9.17)
USB_D_N: Power-Sheet (D5.4 J1.A7 J1.B7), ESP32-Sheet (U8.13)
USB_D_P: Power-Sheet (D5.3 J1.A6 J1.B6), ESP32-Sheet (U8.14)